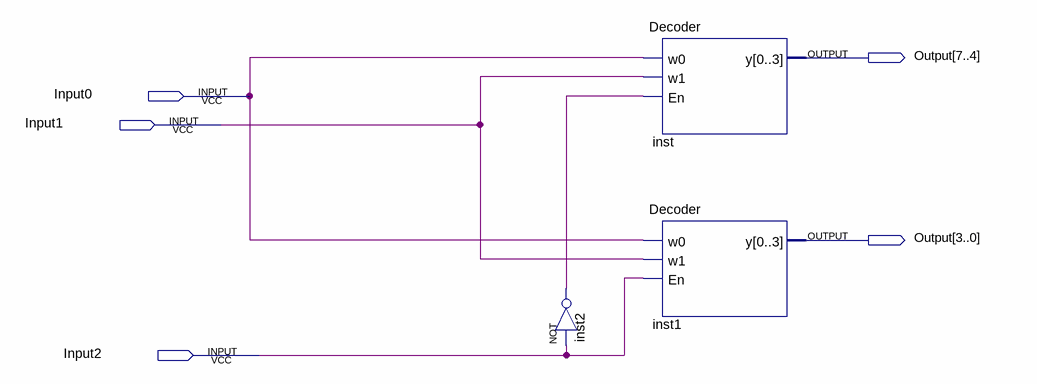
[diagram p0: schematic sheet]
// Quartus schematic 4x16Decoder.bdf as structural Verilog: 3 symbols, 5 pins
module \4x16Decoder  (
  input  Input0,
  input  Input1,
  input  Input2,
  output [7:0] Output
);

  wire inst2_out;

  not inst2 (inst2_out, Input2);
  Decoder inst (.w0(Input0), .w1(Input1), .En(inst2_out), .y(Output[7:4]));
  Decoder inst1 (.w0(Input0), .w1(Input1), .En(Input2), .y(Output[3:0]));
endmodule
